# EAGLE design Adafruit MCP2222 Breakout Rev A (EAGLE 9.6.2)
COMPANY: ADAFRUIT INDUSTRIES; DRAWN: LADYADA; REV: A
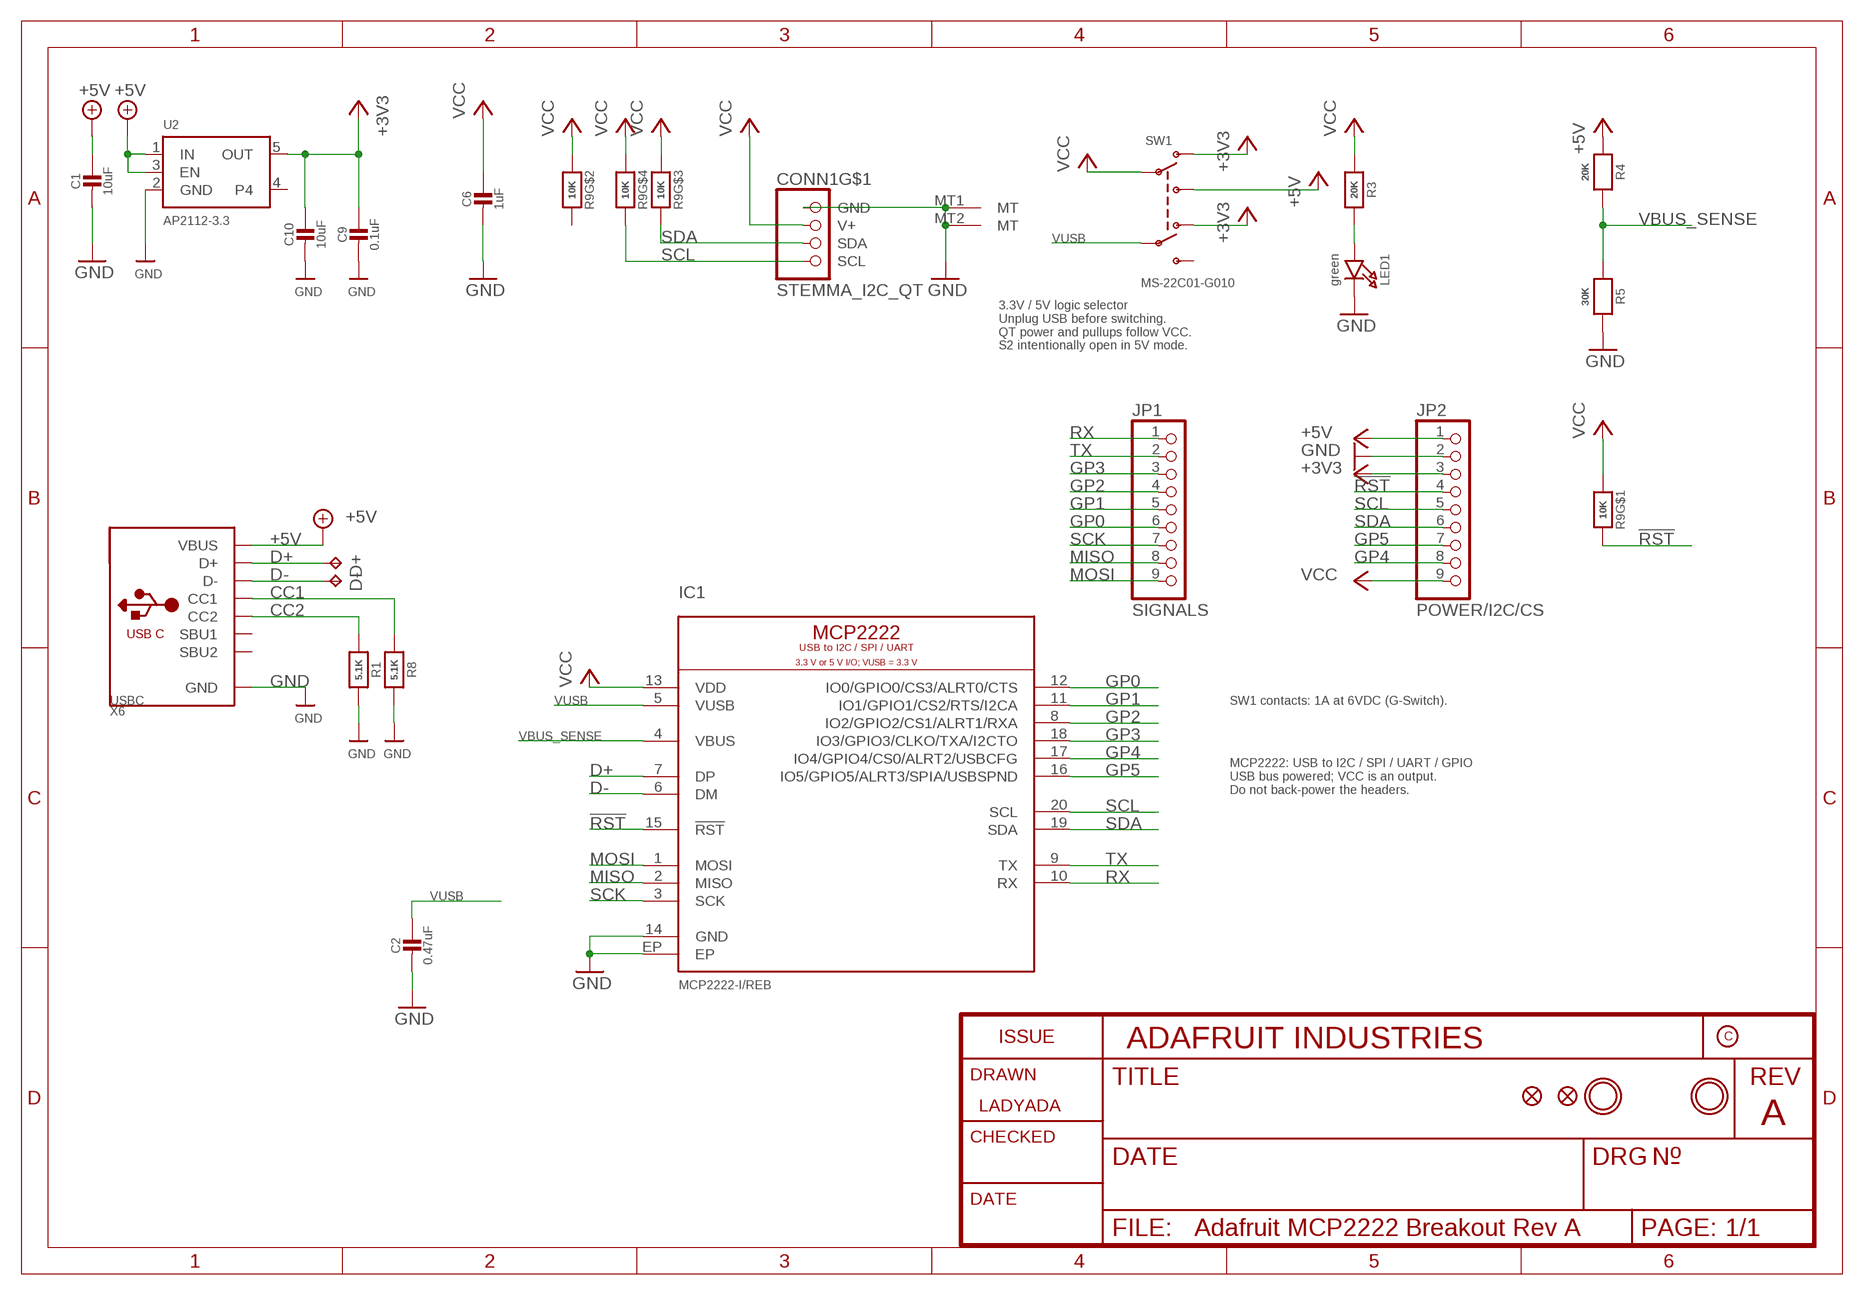
[diagram p0: schematic, sheet 1]

## Parts
C1  10uF  CAP_CERAMIC0805-NOOUTLINE  [0805-NO]
C2  0.47uF  CAP_CERAMIC0603_NO  [0603-NO]
C6  1uF  CAP_CERAMIC0603_NO  [0603-NO]
C9  0.1uF  CAP_CERAMIC0603_NO  [0603-NO]
C10  10uF  CAP_CERAMIC0805-NOOUTLINE  [0805-NO]
CONN1  STEMMA_I2C_QT  [JST_SH4]
D+  TPTP17R  [TP17R]
D-  TPTP17R  [TP17R]
FID1  FIDUCIAL_0.5MM  [FIDUCIAL_0.5MM]
FID2  FIDUCIAL_0.5MM  [FIDUCIAL_0.5MM]
IC1  MCP2222-I/REB  MCP2222_REB  [VQFN20_3X3_P04_EP18_MCP2222]
JP1  SIGNALS  HEADER-1X970MIL  [1X09_ROUND_70]
JP2  POWER/I2C/CS  HEADER-1X970MIL  [1X09_ROUND_70]
LED1  green  LED0603_NOOUTLINE  [CHIPLED_0603_NOOUTLINE]
R1  5.1K  RESISTOR_0603_NOOUT  [0603-NO]
R3  20K  RESISTOR_0603_NOOUT  [0603-NO]
R4  20K  RESISTOR_0603_NOOUT  [0603-NO]
R5  30K  RESISTOR_0603_NOOUT  [0603-NO]
R8  5.1K  RESISTOR_0603_NOOUT  [0603-NO]
R9  10K  RESISTOR_4PACK  [RESPACK_4X0603]
SW1  MS-22C01-G010  SWITCH_DPDTEG1390  [EG1390]
U2  AP2112-3.3  VREG_SOT23-5  [SOT23-5]
U$6  MOUNTINGHOLE2.5  [MOUNTINGHOLE_2.5_PLATED]
U$7  MOUNTINGHOLE2.5  [MOUNTINGHOLE_2.5_PLATED]
X6  USBC  USB_C  [USB_C_CUSB31-CFM2AX-01-X]

## Nets
!RST: IC1.15(!RST) JP2.4 R9.8
+3V3: C9.1 C10.1 JP2.3 SW1.O1 SW1.O2 U2.5(OUT)
+5V: C1.1 JP2.1 R4.1 SW1.S1 U2.1(IN) U2.3(EN) X6.A4B9(VBUS) X6.B4A9(VBUS)
CC1: R8.1 X6.A5(CC1)
CC2: R1.1 X6.B5(CC2)
D+: D+.TP IC1.7(DP) X6.A6(D+) X6.B6(D+)
D-: D-.TP IC1.6(DM) X6.A7(D-) X6.B7(D-)
GND: C1.2 C2.2 C6.2 C9.2 C10.2 CONN1.1(GND) CONN1.MT1(MT) CONN1.MT2(MT) IC1.14(GND) IC1.EP JP2.2 LED1.C R1.2 R5.2 R8.2 U2.2(GND) X6.A1B12(GND) X6.B1A12(GND)
GP0: IC1.12(IO0/GPIO0/CS3/ALRT0/CTS) JP1.6
GP1: IC1.11(IO1/GPIO1/CS2/RTS/I2CA) JP1.5
GP2: IC1.8(IO2/GPIO2/CS1/ALRT1/RXA) JP1.4
GP3: IC1.18(IO3/GPIO3/CLKO/TXA/I2CTO) JP1.3
GP4: IC1.17(IO4/GPIO4/CS0/ALRT2/USBCFG) JP2.8
GP5: IC1.16(IO5/GPIO5/ALRT3/SPIA/USBSPND) JP2.7
MISO: IC1.2(MISO) JP1.8
MOSI: IC1.1(MOSI) JP1.9
N$8: LED1.A R3.2
RX: IC1.10(RX) JP1.1
SCK: IC1.3(SCK) JP1.7
SCL: CONN1.4(SCL) IC1.20(SCL) JP2.5 R9.5
SDA: CONN1.3(SDA) IC1.19(SDA) JP2.6 R9.6
TX: IC1.9(TX) JP1.2
VBUS_SENSE: IC1.4(VBUS) R4.2 R5.1
VCC: C6.1 CONN1.2(V+) IC1.13(VDD) JP2.9 R3.1 R9.1 R9.2 R9.3 R9.4 SW1.P1
VUSB: C2.1 IC1.5(VUSB) SW1.P2
Unconnected: R9.7 SW1.S2 U2.4 X6.A8(SBU1) X6.B8(SBU2)

## Notes on the sheet
- 3.3V / 5V logic selector
  Unplug USB before switching.
  QT power and pullups follow VCC.
  S2 intentionally open in 5V mode.
- SW1 contacts: 1A at 6VDC (G-Switch).
- MCP2222: USB to I2C / SPI / UART / GPIO
  USB bus powered; VCC is an output.
  Do not back-power the headers.

## Library data of the parts
C1 C2 C6 C9 = microbuilder:CAP_CERAMIC: Ceramic Capacitors For new designs, use the packages preceded by an '_' character since they are more reliable: The following footprints should be used on most boards: _0402 - Standard footprint for regular board layouts _0603 - Standard footprint for regular board layouts _0805 - Standard footprint for regular board layouts _1206 - Standard footprint for regular board layouts For extremely tight-pitch boards where space is at a premium, the following 'micro-pitch' footprints can be used (smaller pads, no silkscreen outline, etc.): _0402MP - Micro-pitch footprint for very dense/compact boards _0603MP - Micro-pitch footprint for very dense/compact boards _0805MP - Micro-pitch footprint for very dense/compact boards _1206MP - Micro-pitch footprint for very dense/compact boards
C10 = microbuilder:CAP_CERAMIC: Ceramic Capacitors For new designs, use the packages preceded by an '_' character since they are more reliable: The following footprints should be used on most boards: _0402 - Standard footprint for regular board layouts _0603 - Standard footprint for regular board layouts _0805 - Standard footprint for regular board layouts _1206 - Standard footprint for regular board layouts For extremely tight-pitch boards where space is at a premium, the following 'micro-pitch' footprints can be used (smaller pads, no silkscreen outline, etc.): _0402MP - Micro-pitch footprint for very dense/compact boards _0603MP - Micro-pitch footprint for very dense/compact boards _0805MP - Micro-pitch footprint for very dense/compact boards _1206MP - Micro-pitch footprint for very dense/compact boards; REV: A
CONN1 = adafruit_electromech:STEMMA_I2C; LCSC: C2845363
D+ D- = testpad:TP: Test pad
FID1 FID2 = microbuilder:FIDUCIAL: Fiducial Alignment Points Various fiducial points for machine vision alignment.
IC1 = adafruit_micro:MCP2222: Microchip MCP2222 USB 2.0 to I2C/SPI/UART bridge. DS40002695A. VQFN20 REB. VUSB requires external 3.3V when VDD is 3.3V; VBUS sense nominal 3.0V.; LCSC: C55608692; MPN: MCP2222-I/REB
JP1 JP2 = microbuilder:HEADER-1X9: PIN HEADER
LED1 = microbuilder:LED: LED 0603 - 0603 Surface Mount Package 2mA: Green LED - Low Power (3.9mcd, 2ma, 1.7Vf) - Digikey: 475-2709-2-ND Orange LED - Low Power (9.8mcd, 2ma, 1.8Vf) - Digikey: 475-1194-2-ND Red LED - Low Power (5mcd, 2ma, 1.8Vf) - Digikey: 475-1195-2-ND Yellow LED - Low Power (7mcd, 2ma, 1.8Vf) - Digikey: 475-1196-2-ND 5mA: Blue LED - Low Power (17mcd, 5ma, 2.9Vf) - Digikey: LNJ937W8CRACT-ND 0805 - 0805 Surface Mount Package 2mA: Red LED (8.8mcd, 2mA, 1.8Vf, Clear) - Low Power [Digikey: 475-2510-1-ND] Green LED (5mcd, 2mA, 1.8Vf, Clear) - Low Power [Digikey: 475-2730-1-ND] Yellow LED (11.3mcd, 2mA, 1.8Vf, Clear) - Low Power [Digikey: 475-2555-1-ND] 20mA: Red LED (104mcd, 20mA, Diffused) - LS R976 [Digikey: 475-1278-6-ND] Red LED (12mcd, 20mA, 2.0Vf, Clear) - APT2012EC [Digikey: 754-1128-1-ND] Green LED (15mcd, 20mA, 2.2Vf, Clear) - APT2012GC [Digikey: 754-1131-1-ND] Orange LED (160mcd, 20mA, 2.1Vf, Clear) - APT2012SECK [Digikey: 754-1130-1-ND] 1206 - 1206 Surface Mount Package Green LED (26mcd, 20mA, Diffused) - LG N971 [Digikey: 475-1407-6-ND] Red LED (15mcd, 20mA, Diffused) - LH N974 [Digikey: 475-1416-6-ND] Cree - Cree High-Power Surface Mount LEDs XPEBWT-L1-0000-00D50 - White 111lm 350mA 2.9Vf 6200K 110° XTEAWT-00-0000-00000LEE3 - White 114lm 350mA 2.85Vf 5000K 115° Everlight - Everlight 45-21 Series Surface Mount LEDs 45-21/QK2C-B2832AC2CB2/2T - Warm White 2000mcd 20mA 3.25Vf 3050K 120° 45-21/LK2C-B38452C4CB2/2T - Nuetral White 2000mcd 20mA 3.25Vf 4150K 120° 45-21/LK2C-B50634C6CB2/2T - Cold White 2200mcd 20mA 3.25Vf 5650K 120° PLCC2 Reverse Mount LS T77K-J1L2-1-0-2-R18-Z - Red 11.25mcd 2mA 1.8Vf 630nm 120° LO T77K-L1M2-24-Z - Orange 19.6mcd 2mA 1.8Vf 606nm 120° LY T77K-K2M1-26-Z - Yellow 15.7mcd 2mA 1.8Vf 587nm 120°; ROT: 270
R1 R3-R5 R8 = microbuilder:RESISTOR: Resistors For new designs, use the packages preceded by an '_' character since they are more reliable: The following footprints should be used on most boards: _0402 - Standard footprint for regular board layouts _0603 - Standard footprint for regular board layouts _0805 - Standard footprint for regular board layouts _1206 - Standard footprint for regular board layouts For extremely tight-pitch boards where space is at a premium, the following 'micro-pitch' footprints can be used (smaller pads, no silkscreen outline, etc.): _0402MP - Micro-pitch footprint for very dense/compact boards _0603MP - Micro-pitch footprint for very dense/compact boards _0805MP - Micro-pitch footprint for very dense/compact boards _1206MP - Micro-pitch footprint for very dense/compact boards
R9 = microbuilder:RESISTOR_4PACK: Resistor Packs (4 resistors) 4 x 0603 10K 1/16W - Digikey: YC164J-10KCT-ND
SW1 = adafruit_electromech:SWITCH_DPDT: Switch - DPDT A DPDT Switch acts like an SPDT switch, but has a pair of switches instead of just one. Vertical - 0.3A @ 6V SMT - Digikey: JS202011SCQN; LCSC: C2837066; MPN: MS-22C01-G010
U2 = adafruit_power:VREG_SOT23-5: SOT23-5 Fixed Voltage Regulators Part Current Out V Out V In V Dropout θJA (°C/W) TJ (°C) Digikey Part No. ADP121 150mA 3.3V 3.4-5.5V 0.09V @ 150mA -- -- ADP121-AUJZ33R7CT-ND ADP121 150mA 3.0V 3.1-5.5V 0.09V @ 150mA -- -- ADP121-AUJZ30R7CT-ND ADP122 300mA 3.3V 3.4-5.5V 0.085V @ 300mA -- -- ADP122AUJZ-3.3-R7CT-ND ADP1712 300mA 3.3V 3.5-5.5V 0.17V @ 300mA -- -- ADP1712AUJZ-3.3-R7TR-ND AP7311 (Low Cost) 150mA 3.3V 3.5-6V 0.15V @ 150mA -- -- AP7311-33WG-7DICT-ND LD39015M18R 150mA 1.8V 1.9V-5.5V 0.08V @ 100mA -- -- 497-6977-1-ND LP2985A-33DBVR 150mA 3.3V 3.3-16V 0.28V @ 150mA 206 150 296-18479-1-ND MCP1824T-3302E/OT 300mA 3.3V 3.5V-6V 0.2V @ 300mA -- -- MCP1824T-3302E/OTCT-ND MIC5205-2.5YM5 TR 150mA 2.5V 2.7-16V 0.165V @ 150mA -- -- 576-1257-2-ND MIC5205-3.0YM5 TR 150mA 3.0V 3.2V-16V 0.165V @ 150mA -- -- 576-1258-2-ND MIC5205-3.3YM5 TR 150mA 3.3V 3.5V-16V 0.165V @ 150mA -- -- 576-1259-2-ND TPS780330220 150mA 3.3V+2.2V 3.6-5.5V 250mV Max -- -- 296-23332-1-ND TDA3663/N1,135 100mA 3.3V 3.5-45V 0.18V @ 50mA -- -- 568-5343-1-ND Max operating temp can be calculated using θJA, TJ (max junction temperature), and power in watts. Set the "Maximum Ambient Temperature" until it reaches TJ ("Max Junction Temperature"), which is the absolute limit for safe use of the regulator: Heat Sink Temperature Calculator <http://www.daycounter.com/Calculators/Heat-Sink-Temperature-Calculator.phtml> For example, With 12V source into a 3.3V LP2985 and a 30mA load, we are dissipating (12V-3.3V) * 0.03A = 0.261W. With a θJA of 206 °C/W, a TJ of 150°C, and 261mW we can safely use the chip without a heat sink up to 75°C (=147.1°C Junction Temperature).; JLC_ROTATION: 0
U$6 = adafruit_electromech:MOUNTINGHOLE: Mounting Hole For #2 screws (0.086"/2.18mm width, 0.094"/2.4mm hole) use 2.5mm; BOM: EXCLUDE; REV: A
U$7 = adafruit_electromech:MOUNTINGHOLE: Mounting Hole For #2 screws (0.086"/2.18mm width, 0.094"/2.4mm hole) use 2.5mm; BOM: EXCLUDE
X6 = adafruit_electromech:USB_C: USB Type-C USB 2.0 Connector; LCSC: C165948

## Net classes
1 power: width 0.305 mm
2 gnd: width 0.254 mm

## Board
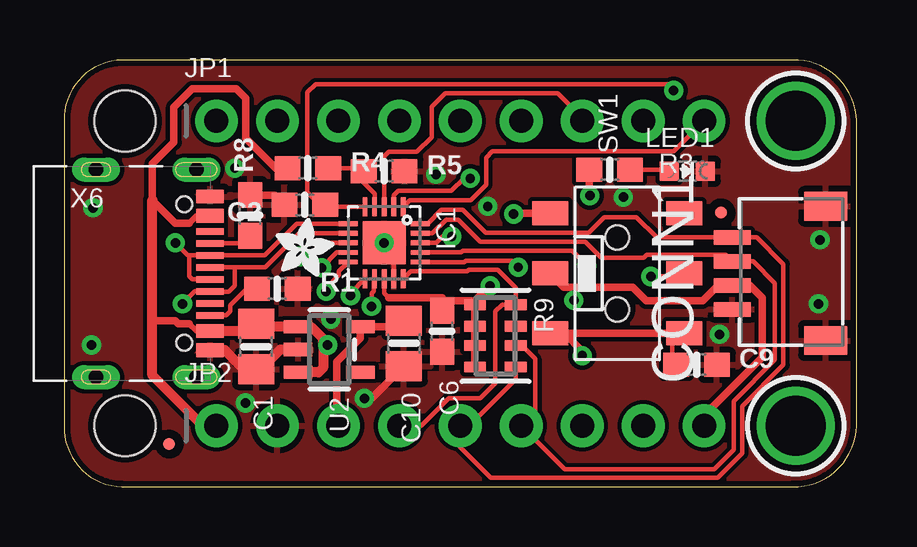
[diagram p1: board, top side]
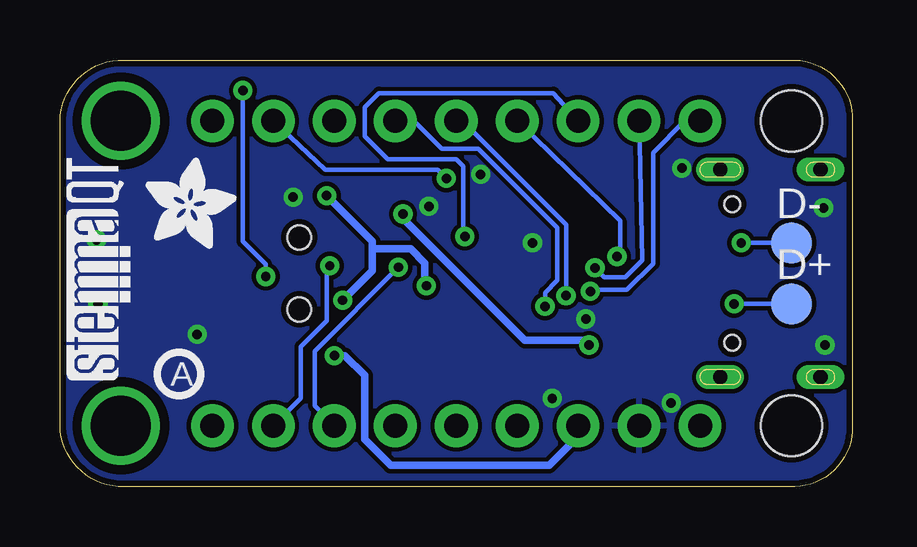
[diagram p2: board, bottom side, seen from below]

Size 33.02 x 17.78 mm. Coordinates in mm from the lower left corner, seen from the top.
Outline: 0,15.24 0,2.54 arc90 2.41,0 30.35,0 arc90 33.02,2.54 33.02,15.24 arc90 30.35,17.78 2.41,17.78 arc90 0,15.24
Copper layers (1*16): Top 0.035mm / dielectric 1.5mm / Bottom 0.035mm
Design rules "adafruit 7-7": minimum track width 7mil, minimum drill 15.5mil, track to track 7mil, track to pad 7mil, pad to pad 7mil, via to via 7mil, smd to smd 7mil, copper to edge 10mil, drill to drill 8mil, minimum pad ring 7mil, minimum via ring 8mil, stop-mask expansion 2mil, vias tented up to drill 20mil, thermal gap 10mil
Holes 2.54 mm at 2.54,15.24 2.54,2.54

### Footprints (pad centres in the part's own frame; a part is rotated, then mirrored left to right if it is on the bottom)
0805-NO = smd 1.24 x 1.5: 1 -0.95,0; 2 0.95,0
0603-NO = smd 1.075 x 1: 1 -0.85,0; 2 0.85,0
JST_SH4 = smd 0.6 x 1.55: 1 -1.5,2.006; 2 -0.5,2.006; 3 0.5,2.006; 4 1.5,2.006 | smd 1.2 x 1.8: MT1 -2.8,-1.894; MT2 2.8,-1.894
TP17R = smd 1.7 x 1.7: TP 0,0
FIDUCIAL_0.5MM = smd 0.5 x 0.5: 1 0,0
VQFN20_3X3_P04_EP18_MCP2222 = smd 0.8 x 0.2: 1 -1.5,0.8; 2 -1.5,0.4; 3 -1.5,0; 4 -1.5,-0.4; 5 -1.5,-0.8; 11 1.5,-0.8; 12 1.5,-0.4; 13 1.5,0; 14 1.5,0.4; 15 1.5,0.8 | smd 0.2 x 0.8: 6 -0.8,-1.5; 7 -0.4,-1.5; 8 0,-1.5; 9 0.4,-1.5; 10 0.8,-1.5; 16 0.8,1.5; 17 0.4,1.5; 18 0,1.5; 19 -0.4,1.5; 20 -0.8,1.5 | smd 1.8 x 1.8: EP 0,0
1X09_ROUND_70 = drill 1 pad 1.778: 1 -10.16,0; 2 -7.62,0; 3 -5.08,0; 4 -2.54,0; 5 0,0; 6 2.54,0; 7 5.08,0; 8 7.62,0; 9 10.16,0
CHIPLED_0603_NOOUTLINE = smd 0.8 x 0.8: A 0,-0.75; C 0,0.75
RESPACK_4X0603 = smd 0.45 x 0.9: 1 -1.3,-0.85; 2 -0.4,-0.85; 3 0.4,-0.85; 4 1.3,-0.85; 5 1.3,0.85; 6 0.4,0.85; 7 -0.4,0.85; 8 -1.3,0.85
EG1390 = smd 1 x 1.5: O1 -2.5,2.8; O2 -2.5,-2.8; P1 0,2.8; P2 0,-2.8; S1 2.5,2.8; S2 2.5,-2.8 | hole 1: 1.5,0; -1.5,0
SOT23-5 = smd 0.55 x 1.2: 1 -0.95,-1.3; 2 0,-1.3; 3 0.95,-1.3; 4 0.95,1.3; 5 -0.95,1.3
MOUNTINGHOLE_2.5_PLATED = drill 2.5 pad 3.2: P$1 0,0
USB_C_CUSB31-CFM2AX-01-X = smd 0.575 x 1.15: A1B12 -3.2,2.275; A4B9 -2.4,2.275; B1A12 3.2,2.275; B4A9 2.4,2.275 | smd 0.275 x 1.15: A5 -1.25,2.275; A6 -0.25,2.275; A7 0.25,2.275; A8 1.25,2.275; B5 1.75,2.275; B6 0.75,2.275; B7 -0.75,2.275; B8 -1.75,2.275 | drill 0.6 pad 1 long: M1 -4.32,1.7; M2 4.32,1.7; M3 -4.32,-2.48; M4 4.32,-2.48 | hole 0.65: 2.89,1.2; -2.89,1.2

### Placement (x,y rotation side)
C1  8,5.84 270 top
C2  10.03,11.75 180 top
C6  15.75,6.48 270 top
C9  26.35,5.08 0 top
C10  14.16,5.97 270 top
CONN1  29.84,8.89 90 top
D+  2.54,7.62 0 bottom
D-  2.54,10.16 0 bottom
FID1  27.38,11.42 0 top
FID2  4.38,1.78 0 top
IC1  13.34,10.16 270 top
JP1  16.51,15.24 0 top
JP2  16.51,2.54 0 top
LED1  25.97,13.14 270 top
PLABEL0  [PLABEL0]  5.97,0.89 0 top
PLABEL1  [PLABEL1]  8.89,0.89 0 top
PLABEL2  [PLABEL2]  11.68,0.89 0 top
PLABEL3  [PLABEL3]  13.91,0.89 0 top
PLABEL4  [PLABEL4]  16.38,0.89 0 top
PLABEL5  [PLABEL5]  18.99,0.89 0 top
PLABEL6  [PLABEL6]  6.35,16.89 0 top
PLABEL7  [PLABEL7]  8.89,16.89 0 top
PLABEL8  [PLABEL8]  11.43,16.89 0 top
PLABEL9  [PLABEL9]  13.97,16.89 0 top
PLABEL10  [PLABEL10]  16.51,16.89 0 top
PLABEL11  [PLABEL11]  18.92,16.89 0 top
PLABEL12  [PLABEL12]  29.46,5.21 0 top
PLABEL13  [PLABEL13]  21.72,16.89 0 top
PLABEL14  [PLABEL14]  24.26,16.83 0 top
PLABEL15  [PLABEL15]  26.73,16.83 0 top
PLABEL16  [PLABEL16]  24.13,0.89 0 top
PLABEL17  [PLABEL17]  21.53,0.89 0 top
PLABEL18  [PLABEL18]  26.67,0.89 0 top
PLABEL19  [PLABEL19]  17.34,11.49 90 top
PLABEL20  [PLABEL20]  22.86,4.57 0 top
PLABEL21  [PLABEL21]  20.38,7.62 0 top
PLABEL22  [PLABEL22]  20.38,10.16 0 top
PLABEL23  [PLABEL23]  29.02,12.7 0 top
PLABEL24  [PLABEL24]  13.84,13.08 0 bottom
PLABEL25  [PLABEL25]  13.72,7.62 0 bottom
R1  8.89,8.26 0 top
R3  22.73,13.21 0 top
R4  10.16,13.27 0 top
R5  13.34,13.14 0 top
R8  7.75,11.3 90 top
R9  17.97,6.29 270 top
SW1  23.05,8.89 90 top
U2  11.05,5.71 270 top
U$1  [ADAFRUIT_3.5MM]  29.46,9.91 0 bottom
U$2  [ADAFRUIT_2.5MM]  8.83,8.76 0 top
U$3  [STEMMAQT]  30.1,4.45 90 bottom
U$4  [PCBFEAT-REV-040]  28.07,4.7 0 bottom
U$6  30.48,15.24 0 top
U$7  30.48,2.54 0 top
X6  3.81,8.89 270 top

### Tracks (layer width: path | path; a pad name or v marks a point on that pad's centre or on a via)
!RST
  Top 0.178: IC1.15 14.45,8.98 16.8,8.98 16.87,9.04 18.06,9.04 18.82,8.29 R9.8 18.25,7.59 17.97,7.3 17.97,4.31 17.35,3.7 16.03,3.7 14.88,2.54 JP2.4
+3V3  (via drill 0.39)
  Top 0.178: SW1.O1 20.85,6.39 | SW1.O2 25.34,6.39 25.34,5.25 C9.1 | 13.91,6.67 C10.1
  Top 0.305: 25.34,6.39 20.85,6.39 21.59,5.65 v21.59,5.46 | JP2.3 11.37,2.6 11.37,5.21 12.35,6.19 U2.5 13.91,6.67
  Bottom 0.305: v21.59,5.46 21.14,5.46 20.32,4.64 20.32,1.97 19.24,0.89 12.64,0.89 11.3,2.22 JP2.3
+5V  (via drill 0.39)
  Top 0.178: X6.B4A9 5.53,6.49 | 18.73,11.39 v18.73,11.37 | v10.98,5.91 10.92,5.91 10.79,6.03
  Top 0.254: 5.22,10.98 5.53,11.29 X6.A4B9 | 5.53,6.49 5.22,6.79
  Top 0.305: 5.22,10.98 4.64,10.98 3.68,11.94 3.68,13.46 4.57,14.35 4.57,15.81 5.33,16.57 7.18,16.57 7.57,16.18 7.57,14.53 8.83,13.27 R4.1 | 5.22,6.79 4.76,6.79 4.64,6.92 3.68,6.92 | SW1.S1 18.73,11.39
  Top 0.406: X6.B4A9 7.7,6.49 C1.1 8.13,6.67 U2.1 10.29,6.67 10.79,6.16 10.79,6.03 10.79,4.95 10.61,4.76 U2.3 | JP2.1 5.78,2.54 3.68,4.64 3.68,6.92 3.68,11.94
  Bottom 0.305: v18.73,11.37 18.73,11.18 13.65,6.1 11.17,6.1 v10.98,5.91
CC1
  Top 0.178: X6.A5 7.43,10.14 R8.1
CC2
  Top 0.178: X6.B5 6.76,7.14 6.93,7.31 6.93,7.56 7.62,8.26 R1.1
D+  (via drill 0.39)
  Top 0.178: X6.A6 7.11,9.14 | 7.11,9.14 8.38,9.14 9.8,10.56 IC1.7 | 7.11,9.14 7.11,8.38 6.86,8.13 6.1,8.13 X6.B6 5.45,8.14 v4.93,7.62
  Bottom 0.178: v4.93,7.62 D+.TP
D-  (via drill 0.39)
  Top 0.178: IC1.6 9.69,10.96 8.37,9.64 X6.B7 6.07,9.65 5.21,9.65 | X6.A7 5.33,8.64 5.21,8.76 5.21,9.65 | 5.21,9.65 5.14,9.65 v4.64,10.16
  Bottom 0.178: v4.64,10.16 D-.TP
GND  (via drill 0.39)
  Top 0.178: IC1.14 13.73,9.76 IC1.EP
  Top 0.305: R8.2 8.78,12.15 C2.2 | C10.2 12.82,3.68 v12.51,3.68
  Top 0.406: U2.2 9.02,5.71 8.19,4.89 C1.2 7.49,4.89 6.7,5.69 X6.B1A12
  other vias: 7.11,13.27 1.21,11.62 1.14,5.91 7.56,3.49 11.11,6.99 13.34,10.16 15.49,13.02 23.3,12.06 31.43,7.62 31.5,10.29 27.3,6.35 17.65,11.68
  pour Top: 0,0 33.02,0 33.02,17.78 0,17.78
  pour Bottom: 0,0.06 33.02,0.06 33.02,17.84 0,17.84
GP0  (via drill 0.39)
  Top 0.178: IC1.12 12.9,8.63 12.9,8.15 12.81,8.06 v12.81,7.52
  Bottom 0.178: v12.81,7.52 12.81,8.09 12.3,8.6 12.3,10.78 15.6,14.08 17.12,14.08 18.27,15.24 JP1.6
GP1  (via drill 0.39)
  Top 0.178: IC1.11 11.93,8.06 v11.93,7.96
  Bottom 0.178: v11.93,7.96 11.93,10.92 16.26,15.24 JP1.5
GP2  (via drill 0.39)
  Top 0.178: IC1.8 10.79,10.16 10.22,9.59 v9.81,9.59
  Bottom 0.178: JP1.4 9.68,11.08 9.68,9.72 v9.81,9.59
GP3  (via drill 0.39)
  Top 0.178: IC1.18 15.51,10.16 15.77,10.43 v16.15,10.43
  Bottom 0.178: v16.15,10.43 16.22,10.49 16.22,13.36 16.51,13.65 19.37,13.65 20.32,14.61 20.32,15.81 19.74,16.4 12.46,16.4 JP1.3
GP4  (via drill 0.39)
  Top 0.178: IC1.17 16.55,9.76 16.61,9.82 21.16,9.82 v21.78,9.21
  Bottom 0.178: v21.78,9.21 21.91,9.08 21.91,6.92 22.99,5.84 22.99,3.68 JP2.8
GP5  (via drill 0.39)
  Top 0.178: v18.92,9.14 18.64,9.42 16.74,9.42 16.68,9.36 IC1.16
  Bottom 0.178: v18.92,9.14 22.42,5.65 22.42,3.37 JP2.7
MISO  (via drill 0.39)
  Top 0.178: IC1.2 13.73,12.15 13.91,12.33 16.14,12.33 16.66,12.85 v16.92,12.85
  Bottom 0.178: v16.92,12.85 17.28,13.21 21.97,13.21 JP1.8
MOSI
  Top 0.178: IC1.1 14.41,11.94 16.95,11.94 17.59,12.57 17.59,13.72 17.85,13.97 25.41,13.97 JP1.9
N$8
  Top 0.178: LED1.A 25.16,13.21 R3.2
RX  (via drill 0.39)
  Top 0.178: IC1.10 11.45,8.98 11.45,8.8 10.92,8.27 v10.92,8.14
  Bottom 0.178: v10.92,8.14 10.87,8.2 9.39,8.2 8.3,9.29 8.3,13.92 6.99,15.24 JP1.1
SCK
  Top 0.178: IC1.3 13.34,13.77 13.52,13.96 14.7,13.96 15.32,14.57 15.32,15.82 15.89,16.4 20.56,16.4 21.59,15.37 JP1.7
SCL
  Top 0.178: IC1.20 15.15,10.96 15.72,11.53 16.61,11.53 17.57,10.58 21.86,10.58 22.51,11.23 23.84,11.23 24.69,10.39 CONN1.4 28.85,10.39 29.97,9.27 29.97,5.07 28.25,3.35 28.25,1.39 27.24,0.38 17.78,0.38 16.51,1.65 JP2.5 16.89,2.54 18.82,4.47 R9.5
SDA
  Top 0.178: IC1.19 15.34,10.56 15.91,11.13 16.42,11.13 17.34,10.21 21.72,10.21 22.38,9.55 24.16,9.55 24.27,9.66 27.57,9.66 CONN1.3 28.71,9.39 29.62,8.48 29.62,5.28 27.89,3.56 27.89,1.53 27.09,0.74 20.85,0.74 JP2.6 19.63,3.12 19.63,5.33 19.07,5.89 R9.6
TX  (via drill 0.39)
  Top 0.178: IC1.9 11.36,9.76 10.73,9.13 v10.73,9.12
  Bottom 0.178: v10.73,9.12 10.34,8.73 9.48,8.73 8.76,9.45 JP1.2
VBUS_SENSE
  Top 0.178: 12.32,13.27 R4.2 | IC1.4 12.94,12.21 12.32,12.83 12.32,13.27 | R5.1 12.45,13.14 12.32,13.27
VCC  (via drill 0.39)
  Top 0.178: CONN1.2 28.57,8.39 | 26.67,2.98 JP2.9 | IC1.13 13.34,8.06 13.53,7.87 | 21.88,12.15 v21.91,12.13
  Top 0.305: 28.57,8.39 29.08,7.87 29.08,5.4 26.67,2.98 | SW1.P1 20.82,8.32 21.27,8.32 | 21.27,8.32 23.69,8.32 24.26,7.75 26.61,7.75 27.33,8.47 CONN1.2 | R3.1 21.88,12.15 | R9.1 16.96,7.75 15.75,7.75 | 13.53,7.87 15.75,7.87 15.75,7.75 | R9.1 R9.2 R9.3 R9.4 | C6.1 15.75,7.75 | v21.24,7.77 21.24,8.29 21.27,8.32 | v17.75,8.37 17.12,7.74 R9.1
  Bottom 0.305: v21.91,12.13 20,10.22 20,9.91 | 20,9.91 20,9.01 v21.24,7.77 | v17.75,8.37 17.82,8.44 17.82,9.31 18.41,9.91 20,9.91
VUSB  (via drill 0.39)
  Top 0.178: IC1.5 10.97,11.66 C2.1 10.67,11.75 10.14,12.27 10.14,16.43 10.48,16.76 25.15,16.76 v25.4,16.51 | v24.45,8.76 25.47,8.76 SW1.P2
  Bottom 0.178: v25.4,16.51 25.4,10.22 24.45,9.27 v24.45,8.76

### Text on the board
Pinguin_tBackup: RX | TX | G3 | G2 | G1 | G0 | SCK | MI | MO | QT | MCP / 2222 | 5V | 3V | Vlogic | I2C | 5V | GND | 3V | !R | SCL | SDA | G4 | G5 | Vio
Pinguin_bBackup: MCP2222 | USB to I2C/SPI/UART/GPIO / 3.3V or 5V Logic Level / I2C: Max 1 MHz / SPI: Max 12 MHz / UART: Max 1 Mbps